# EAGLE schematic fuente_buck_50v-12v_10A (EAGLE 7.6.0)
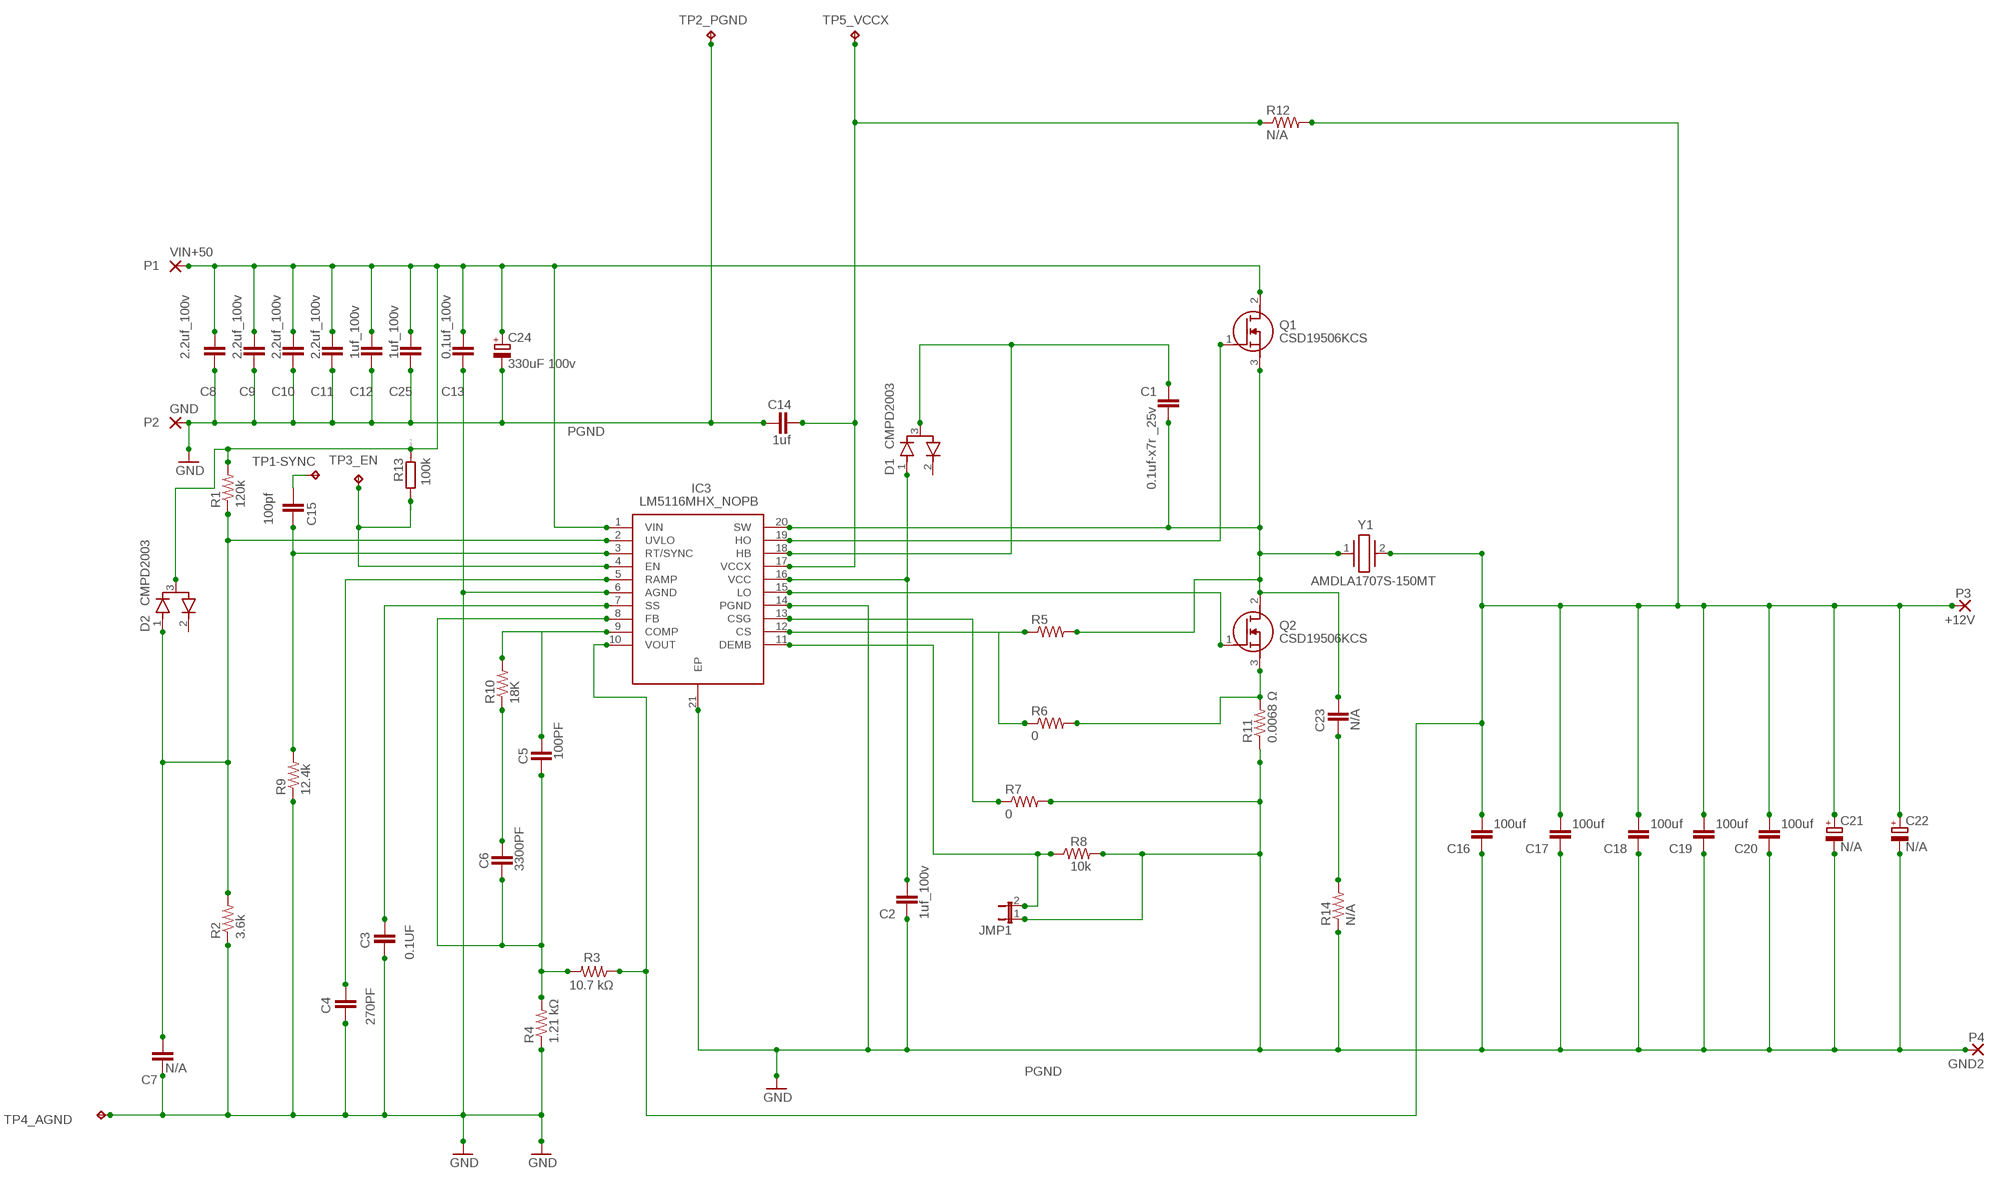
[diagram p0: schematic, sheet 1]

## Parts
+12V  P3  2,54/1,1  [2,54/1,1]
C1  0.1uf-x7r _25v  C-EUC0805  [C0805]
C2  1uf_100v  C-EUC0805  [C0805]
C3  0.1UF  C-EUC0805  [C0805]
C4  270PF  C-EUC0805  [C0805]
C5  100PF  C-EUC0805  [C0805]
C6  3300PF  C-EUC0805  [C0805]
C7  N/A  C-EUC0805  [C0805]
C8  2.2uf_100v  C-EUC0805  [C0805]
C9  2.2uf_100v  C-EUC0805  [C0805]
C10  2.2uf_100v  C-EUC0805  [C0805]
C11  2.2uf_100v  C-EUC0805  [C0805]
C12  1uf_100v  C-EUC0805  [C0805]
C13  0.1uf_100v  C-EUC0805  [C0805]
C14  1uf  C-EUC0805  [C0805]
C15  100pf  C-EUC0805  [C0805]
C16  100uf  C-EUC0805  [C0805]
C17  100uf  C-EUC0805  [C0805]
C18  100uf  C-EUC0805  [C0805]
C19  100uf  C-EUC0805  [C0805]
C20  100uf  C-EUC0805  [C0805]
C21  N/A  CPOL-EUE5-10.5  [E5-10,5]
C22  N/A  CPOL-EUE5-10.5  [E5-10,5]
C23  N/A  C-EUC0805  [C0805]
C24  330uF 100v  CPOL-EUE5-10.5  [E5-10,5]
C25  1uf_100v  C-EUC0805  [C0805]
D1  CMPD2003  BAV99  [DIO_BAV99]
D2  CMPD2003  BAV99  [DIO_BAV99]
GND  P2  2,54/1,1  [2,54/1,1]
GND2  P4  2,54/1,1  [2,54/1,1]
IC3  LM5116MHX_NOPB  [SOP65P640X110-21N]
JMP1  JP1E  [JP1]
Q1  CSD19506KCS  [TO254P470X1016X1611-3P]
Q2  CSD19506KCS  [TO254P470X1016X1611-3P]
R1  120k  R-US_M0805  [M0805]
R2  3.6k  R-US_M0805  [M0805]
R3  10.7 kΩ  R-US_M0805  [M0805]
R4  1.21 kΩ  R-US_M0805  [M0805]
R5  R-US_M0805  [M0805]
R6  0  R-US_M0805  [M0805]
R7  0  R-US_M0805  [M0805]
R8  10k  R-US_M0805  [M0805]
R9  12.4k  R-US_M0805  [M0805]
R10  18K  R-US_M0805  [M0805]
R11  0.0068 Ω  R-US_M0805  [M0805]
R12  N/A  R-US_M0805  [M0805]
R13  100k  R  [R0805]
R14  N/A  R-US_M0805  [M0805]
TP1-SYNC  TP1  TPPAD1-13  [P1-13]
TP2_PGND  TPPAD1-13  [P1-13]
TP3_EN  TPPAD1-13  [P1-13]
TP4_AGND  TPPAD1-13  [P1-13]
TP5_VCCX  TPPAD1-13  [P1-13]
VIN+50  P1  2,54/1,1  [2,54/1,1]
Y1  AMDLA1707S-150MT  [INDPM178169X700N]

## Nets
10K [power]: C2.1 D1.1 IC3.16(VCC)
GND [power]: C2.2 C3.2 C4.2 C7.2 C8.2 C9.2 C10.2 C11.2 C12.2 C13.2 C14.1 C16.2 C17.2 C18.2 C19.2 C20.2 C21.- C22.- C24.- C25.2 GND2.1(P) GND.1(P) IC3.6(AGND) IC3.14(PGND) IC3.21(EP) JMP1.1 R2.1 R4.1 R7.2 R8.2 R9.1 R11.1 R14.1 TP2_PGND.TP TP4_AGND.TP
N$1: C5.2 C6.2 IC3.8(FB) R3.2 R4.2
N$2: C8.1 C9.1 C10.1 C11.1 C12.1 C13.1 C24.+ C25.1 D2.3 IC3.1(VIN) Q1.2(D) R1.2 R13.2 VIN+50.1(P)
N$3: C23.1 R14.2
N$4: C7.1 D2.1 IC3.2(UVLO) R1.1 R2.2
N$5: C15.2 IC3.3(RT/SYNC) R9.2
N$6: C15.1 TP1-SYNC.TP
N$7: C4.1 IC3.5(RAMP)
N$8: C3.1 IC3.7(SS)
N$9: C14.2 IC3.17(VCCX) R12.1 TP5_VCCX.TP
N$10: C5.1 IC3.9(COMP) R10.2
N$11: IC3.19(HO) Q1.1(G)
N$12: C6.1 R10.1
N$14: +12V.1(P) C16.1 C17.1 C18.1 C19.1 C20.1 C21.+ C22.+ IC3.10(VOUT) R3.1 R12.2 Y1.2
N$16: IC3.4(EN) R13.1 TP3_EN.TP
N$17: C1.1 C23.2 IC3.20(SW) Q1.3(S) Q2.2(D) R5.2 Y1.1
N$18: IC3.15(LO) Q2.1(G)
N$19: C1.2 D1.3 IC3.18(HB)
N$20: IC3.13(CSG) R7.1
N$21: Q2.3(S) R6.2 R11.2
N$23: IC3.11(DEMB) JMP1.2 R8.1
N$24: IC3.12(CS) R5.1 R6.1
Unconnected: D1.2 D2.2

## Notes on the sheet
- PGND
- PGND

## Library data of the parts
+12V GND GND2 VIN+50 = wirepad:2,54/1,1: THROUGH-HOLE PAD
C1-C20 C23 C25 = rcl:C-EU: CAPACITOR, European symbol
C21 C22 C24 = rcl:CPOL-EU: POLARIZED CAPACITOR, European symbol
D1 D2 = BAV99:BAV99; MANUFACTURER: On Semi; MAXIMUM_PACKAGE_HEIGHT: 1.2 mm; PARTREV: 1.1.0; SNAPEDA_PN: BAV99; STANDARD: Manufacturer Recommendations
IC3 = LM5116MHX_NOPB:LM5116MHX_NOPB: 6-100V Wide Vin, Current Mode Synchronous Buck Controller Source: Datasheet <http://www.ti.com/lit/gpn/lm5116>; DESCRIPTION: 6-100V Wide Vin, Current Mode Synchronous Buck Controller; HEIGHT: 1.1mm; MANUFACTURER_NAME: Texas Instruments; MANUFACTURER_PART_NUMBER: LM5116MHX/NOPB; MOUSER_PART_NUMBER: 926-LM5116MHX/NOPB; MOUSER_PRICE-STOCK: https://www.mouser.co.uk/ProductDetail/Texas-Instruments/LM5116MHX-NOPB?qs=QbsRYf82W3EaCl%2FW15P7yA%3D%3D
JMP1 = jumper:JP1E: JUMPER
Q1 Q2 = CSD19506KCS:CSD19506KCS: Texas Instruments CSD19506KCS N-channel MOSFET Transistor, 273 A, 80 V, 3-Pin TO-220 Source: Datasheet <http://www.ti.com/lit/gpn/csd19506kcs>; DESCRIPTION: Texas Instruments CSD19506KCS N-channel MOSFET Transistor, 273 A, 80 V, 3-Pin TO-220; HEIGHT: 4.7mm; MANUFACTURER_NAME: Texas Instruments; MANUFACTURER_PART_NUMBER: CSD19506KCS; MOUSER_PART_NUMBER: 595-CSD19506KCS; MOUSER_PRICE-STOCK: https://www.mouser.co.uk/ProductDetail/Texas-Instruments/CSD19506KCS?qs=8sOby8ZxZLGQrkLPFGWmvQ%3D%3D
R1-R12 R14 = rcl:R-US_: RESISTOR, American symbol
R13 = eagle-ltspice:R: RESISTOR, European symbol; SPICEMODEL: NONE; SPICEPREFIX: R
TP1-SYNC TP2_PGND TP3_EN TP4_AGND TP5_VCCX = testpad:TP: Test pad
Y1 = AMDLA1707S-150MT:AMDLA1707S-150MT: 15 H Shielded Molded Inductor 16 A 15.5mOhm Max Nonstandard - Source: Datasheet <https://abracon.com/datasheets/AMDLA1707S.pdf>; DESCRIPTION: 15 H Shielded Molded Inductor 16 A 15.5mOhm Max Nonstandard -; HEIGHT: 7mm; MANUFACTURER_NAME: ABRACON; MANUFACTURER_PART_NUMBER: AMDLA1707S-150MT; MOUSER_PART_NUMBER: 815-AMDLA1707S-150MT; MOUSER_PRICE-STOCK: https://www.mouser.co.uk/ProductDetail/ABRACON/AMDLA1707S-150MT?qs=DPoM0jnrROXZdMVrsDE%2FmQ%3D%3D

## Net classes
0 default: width 0.152 mm, drill 0.305 mm, clearance 0.152 mm
1 power: width 0.127 mm, drill 0.305 mm, clearance 0.127 mm
2 thin: width 0.508 mm, drill 0.305 mm, clearance 0.152 mm